# EAGLE design alarm (EAGLE 9.6.2)
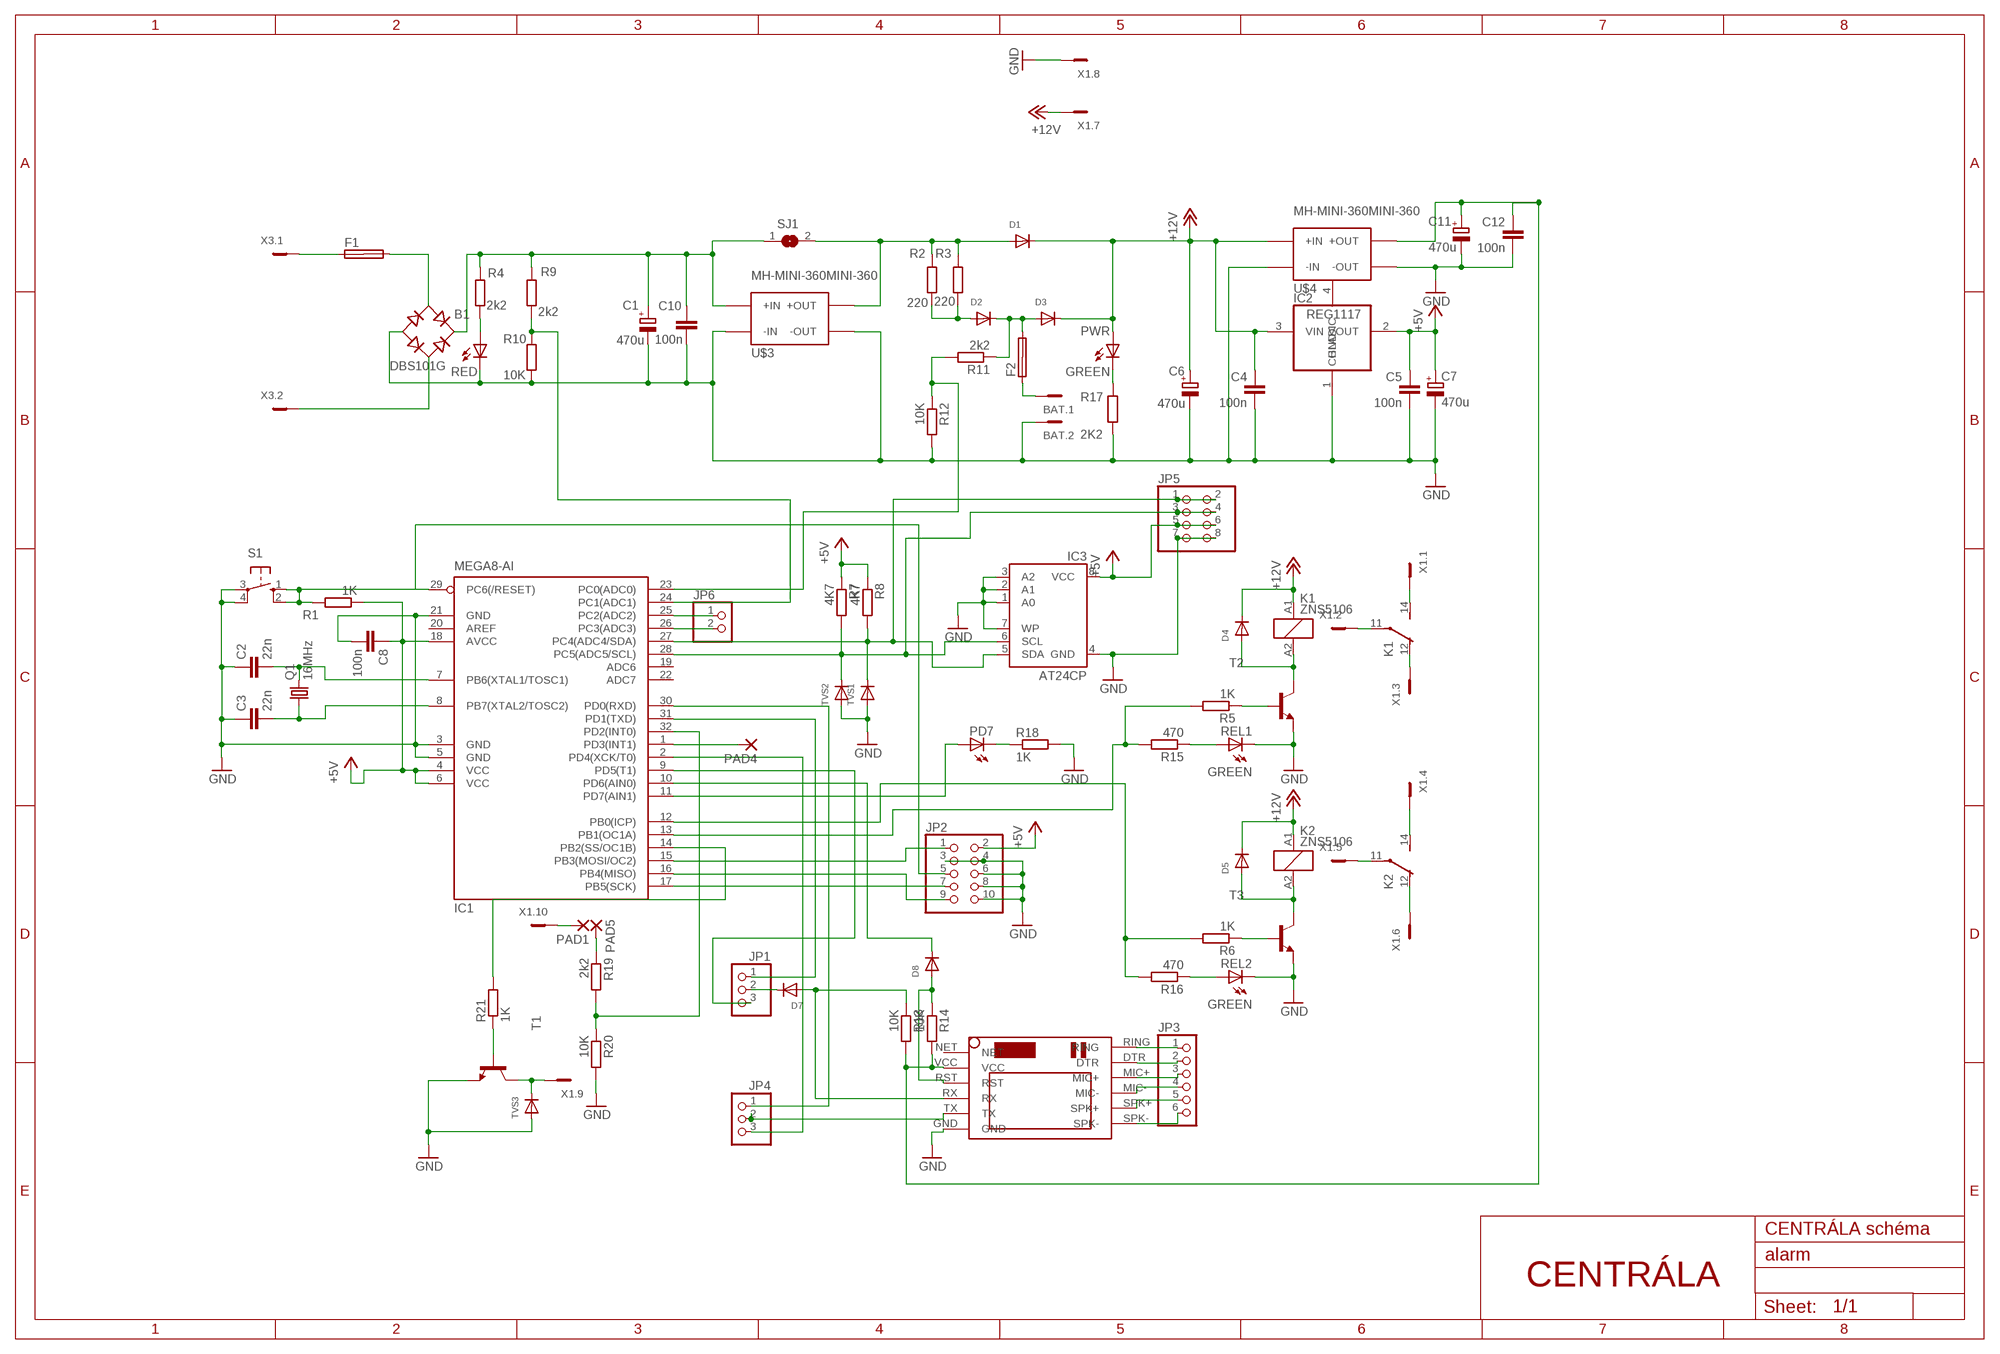
[diagram p0: schematic, sheet 1]

## Parts
B1  DBS101G  [DBS]
BAT  MCV2  [MCV2]
C1  470u  CPOL-EU153CLV-0810  [153CLV-0810]
C2  22n  C-EUC0805  [C0805]
C3  22n  C-EUC0805  [C0805]
C4  100n  C-EUC0805  [C0805]
C5  100n  C-EUC0805  [C0805]
C6  470u  CPOL-EU153CLV-0810  [153CLV-0810]
C7  470u  CPOL-EU153CLV-0810  [153CLV-0810]
C8  100n  C-EUC0805  [C0805]
C10  100n  C-EUC0805  [C0805]
C11  470u  CPOL-EU153CLV-0810  [153CLV-0810]
C12  100n  C-EUC0805  [C0805]
D1  DIODE_SOD-123FL  [SOD-123FL]
D2  DIODE_SOD-123FL  [SOD-123FL]
D3  DIODE_SOD-123FL  [SOD-123FL]
D4  DIODE_SOD-123FL  [SOD-123FL]
D5  DIODE_SOD-123FL  [SOD-123FL]
D7  DIODE_SOD-123FL  [SOD-123FL]
D8  DIODE_SOD-123FL  [SOD-123FL]
F1  SHK20L  [SHK20L]
F2  SHK20L  [SHK20L]
IC1  MEGA8-AI  [TQFP32-08]
IC2  REG1117  [SOT223]
IC3  AT24CP  [DIL08]
JP1  PINHD-1X3  [1X03]
JP2  PINHD-2X5  [2X05]
JP3  PINHD-1X6  [1X06]
JP4  PINHD-1X3  [1X03]
JP5  PINHD-2X4  [2X04]
JP6  PINHD-1X2  [1X02]
K1  ZNS5106  [ZN5]
K2  ZNS5106  [ZN5]
PAD1  2,54/0,8  [2,54/0,8]
PAD4  2,54/0,8  [2,54/0,8]
PAD5  2,54/0,8  [2,54/0,8]
PD7  LEDCHIPLED_0805  [CHIPLED_0805]
PWR  GREEN  LEDCHIPLED_0805  [CHIPLED_0805]
Q1  16MHz  CRYSTALHC49UP  [HC49UP]
R1  1K  R-EU_R0805  [R0805]
R2  220  R-EU_R1210  [R1210]
R3  220  R-EU_R1210  [R1210]
R4  2k2  R-EU_R0805  [R0805]
R5  1K  R-EU_R0805  [R0805]
R6  1K  R-EU_R0805  [R0805]
R7  4K7  R-EU_R0805  [R0805]
R8  4K7  R-EU_R0805  [R0805]
R9  2k2  R-EU_R0805  [R0805]
R10  10K  R-EU_R0805  [R0805]
R11  2k2  R-EU_R0805  [R0805]
R12  10K  R-EU_R0805  [R0805]
R13  10K  R-EU_R0805  [R0805]
R14  10K  R-EU_R0805  [R0805]
R15  470  R-EU_R0805  [R0805]
R16  470  R-EU_R0805  [R0805]
R17  2K2  R-EU_R0805  [R0805]
R18  1K  R-EU_R0805  [R0805]
R19  2k2  R-EU_R0805  [R0805]
R20  10K  R-EU_R0805  [R0805]
R21  1K  R-EU_R0805  [R0805]
REL1  GREEN  LEDCHIPLED_0805  [CHIPLED_0805]
REL2  GREEN  LEDCHIPLED_0805  [CHIPLED_0805]
S1  10-XX  [B3F-10XX]
SJ1  SJW  [SJW]
SUPPLY  RED  LEDCHIPLED_0805  [CHIPLED_0805]
T1  BC808-NPN-SOT23-BEC  [SOT23-BEC]
T2  BC808-NPN-SOT23-BEC  [SOT23-BEC]
T3  BC808-NPN-SOT23-BEC  [SOT23-BEC]
TVS1  DIODE_SOD-123FL  [SOD-123FL]
TVS2  DIODE_SOD-123FL  [SOD-123FL]
TVS3  DIODE_SOD-123FL  [SOD-123FL]
U$1  SIM800LMODULE  [SIM800LMODULE]
U$3  MH-MINI-360MINI-360  [MH-MINI-360]
U$4  MH-MINI-360MINI-360  [MH-MINI-360]
X1  MCV10  [MCV10]
X3  MCV2  [MCV2]

## Nets
+4.4V: C11.+ C12.2 R13.2 R14.2 U$1.VCC U$4.P$3(+OUT)
+5V: C5.2 C7.+ C8.1 IC1.4(VCC) IC1.6(VCC) IC1.18(AVCC) IC2.2(VOUT) IC3.8(VCC) JP2.2 JP5.5 JP5.6 R1.1 R7.1 R8.1
+12V: C4.2 C6.+ D1.C D3.C D4.C D5.C IC2.3(VIN) K1.A1 K2.A1 PWR.A U$4.P$2(+IN) X1.7
GND: B1.- BAT.2 C1.- C2.1 C3.1 C4.1 C5.1 C6.- C7.- C8.2 C10.1 C11.- C12.1 IC1.3(GND) IC1.5(GND) IC1.21(GND) IC2.1(GND) IC3.1(A0) IC3.2(A1) IC3.3(A2) IC3.4(GND) IC3.7(WP) JP2.3 JP2.4 JP2.6 JP2.8 JP2.10 JP5.7 JP5.8 R10.2 R12.2 R17.2 R18.2 R20.2 REL1.C REL2.C S1.3(P) S1.4(P1) SUPPLY.C T1.E T2.E T3.E TVS1.A TVS2.A TVS3.A U$1.GND U$3.P$1(-IN) U$3.P$4(-OUT) U$4.P$1(-IN) U$4.P$4(-OUT) X1.8
N$1: B1.AC1 F1.2A
N$2: B1.AC2 X3.2
N$3: B1.+ C1.+ C10.2 R4.1 R9.1 SJ1.1 U$3.P$2(+IN)
N$4: JP3.6 U$1.SPK-
N$5: D1.A R2.2 R3.2 SJ1.2 U$3.P$3(+OUT)
N$6: D2.A R2.1 R3.1
N$7: D2.C D3.A F2.2A R11.1
N$8: BAT.1 F2.1A
N$9: C3.2 IC1.8(PB7(XTAL2/TOSC2)) Q1.1
N$10: F1.1A X3.1
N$11: IC1.15(PB3(MOSI/OC2)) JP2.1
N$12: C2.2 IC1.7(PB6(XTAL1/TOSC1)) Q1.2
N$13: IC1.17(PB5(SCK)) JP2.7
N$14: R4.2 SUPPLY.A
N$15: IC1.29(PC6(/RESET)) JP2.5 R1.2 S1.1(S) S1.2(S1)
N$16: IC1.16(PB4(MISO)) JP2.9
N$17: IC1.28(PC5(ADC5/SCL)) IC3.6(SCL) JP5.3 JP5.4 R7.2 TVS2.C
N$18: PAD1.1(P) X1.10
N$19: IC1.24(PC1(ADC1)) R9.2 R10.1
N$20: D5.A K2.A2 T3.C
N$21: D4.A K1.A2 T2.C
N$22: R5.1 T2.B
N$23: R6.1 T3.B
N$24: IC1.13(PB1(OC1A)) R5.2 R15.2
N$26: K1.14(2:S) X1.1
N$27: K1.11(2:P) X1.2
N$28: K1.12(2:O) X1.3
N$29: K2.14(2:S) X1.4
N$30: K2.11(2:P) X1.5
N$31: K2.12(2:O) X1.6
N$32: IC1.23(PC0(ADC0)) R11.2 R12.1
N$33: JP3.5 U$1.SPK+
N$34: JP3.4 U$1.MIC-
N$35: JP3.3 U$1.MIC+
N$36: JP3.2 U$1.DTR
N$37: JP3.1 U$1.RING
N$38: JP4.2 U$1.TX
N$39: D7.A R13.1 U$1.RX
N$40: IC1.31(PD1(TXD)) JP1.1
N$41: IC1.30(PD0(RXD)) JP4.1
N$42: IC1.2(PD4(XCK/T0)) JP4.3
N$43: D7.C JP1.2
N$44: IC1.9(PD5(T1)) JP1.3
N$45: D8.A R14.1 U$1.RST
N$46: R16.1 REL2.A
N$47: D8.C IC1.10(PD6(AIN0))
N$48: R15.1 REL1.A
N$49: PWR.C R17.1
N$50: PD7.C R18.1
N$51: IC1.11(PD7(AIN1)) PD7.A
N$52: IC1.27(PC4(ADC4/SDA)) IC3.5(SDA) JP5.1 JP5.2 R8.2 TVS1.C
N$53: IC1.32(PD2(INT0)) R19.2 R20.1
N$54: IC1.14(PB2(SS/OC1B)) R21.2
N$55: IC1.25(PC2(ADC2)) JP6.1
N$56: IC1.26(PC3(ADC3)) JP6.2
N$57: IC1.1(PD3(INT1)) PAD4.1(P)
N$58: R21.1 T1.B
N$59: T1.C TVS3.C X1.9
N$60: PAD5.1(P) R19.1
N$62: IC1.12(PB0(ICP)) R6.2 R16.2
Unconnected: F1.1B F1.2B F2.1B F2.2B IC1.19(ADC6) IC1.20(AREF) IC1.22(ADC7) U$1.NET

## Notes on the sheet
- CENTRÁLA schéma
- CENTRÁLA

## Power pins joined to a net without a drawn wire
CHLADIC: IC2.4(CHLADIC)

## Library data of the parts
B1 = rectifier:DB?*G: Single Phase 1.0 AMP Glass Passivated Bridge Rectifier Taiwan Semiconductor Co.,Ltd. - TSC Source: http://www.taiwansemi.com/TSCbig5/ezcatfiles/cust/img/img/db101g.pdf http://www.ts.com.tw/db/pictures/modules/PDT/PDT060207001/DBLS201G.pdf
BAT X3 = con-phoenix_3.81_mcv:MCV2: Mini-Combicon 3.81mm vertikal 2polig (ohne Gegenstecker)
C1 C6 C7 C11 = rcl:CPOL-EU: POLARIZED CAPACITOR, European symbol; SPICEPREFIX: C
C2-C5 C8 C10 C12 = rcl:C-EU: CAPACITOR, European symbol; SPICEPREFIX: C
D1-D5 D7 D8 TVS1-TVS3 = adafruit:DIODE: Diode SMADIODE - SMA Surface Mount Package 20V 1A Schottky Diode Digikey: 641-1014-6-ND DO-1N4148 - Through Hole Small Current Diode SOD-123 20V 1 A (.5mV Vf) Schottky Diode - Digikey: MBRX120TPMSCT-ND SOD-323 10V 570mA (.38mV Vf, 3ns) Schottky Diode - Digikey: ZLLS410CT-ND SOD-523 30V 30mA Schottky Diode (RB751S-40TE61) - Digikey: RB751S-40TE61CT-ND SOT23-R/W - SOT23 Package (R = Solder Paste/Reflow Ovens, W = Hand-Soldering) BAT54Film 40V 300mA - Digikey: 497-7162-1-ND
F1 F2 = fuse:SHK20L: FUSE HOLDER 5 x 20 mm, SH contact, SHH1 Schukat, E1073 Buerklin; OC_FARNELL: unknown; OC_NEWARK: unknown
IC1 = atmel:MEGA8: MICROCONTROLLER 8 Kbytes FLASH, 1 kbytes SRAM, 512 bytes EEPROM, USART, 6-channel 10 bit ADC, 2-channel 8 bit ADC Pin compatible with Atmega48, ATMega88, ATMega168 Source: avr.lbr; MPN: ATMEGA8-16AU; OC_FARNELL: 9171371; OC_NEWARK: 73M8863
IC2 = burr-brown:REG1117: 800mA and 1A Low Dropout (LDO) Positive Regulator 1.8V, 2.5V, 2.85V, 3.3V, 5V, and Adj; MPN: REG1117; OC_FARNELL: 1097566; OC_NEWARK: 14P6981
IC3 = atmel:AT24C*: 2-wire serial EEPROM; MPN: AT24C1024BW-SH-B; OC_FARNELL: 1362646; OC_NEWARK: 03P2044
JP1 JP4 = pinhead:PINHD-1X3: PIN HEADER
JP2 = pinhead:PINHD-2X5: PIN HEADER
JP3 = pinhead:PINHD-1X6: PIN HEADER
JP5 = pinhead:PINHD-2X4: PIN HEADER
JP6 = pinhead:PINHD-1X2: PIN HEADER
K1 K2 = relay:ZNS5*: Miniature Power PCB Relay SCHRACK 1pole 10 A Source: http://www.schrack.com/.. 5847.pdf
PAD1 PAD4 PAD5 = wirepad:2,54/0,8: THROUGH-HOLE PAD
PD7 PWR REL1 REL2 SUPPLY = led:LED: LED OSRAM: - CHIPLED LG R971, LG N971, LY N971, LG Q971, LY Q971, LO R971, LY R971 LH N974, LH R974 LS Q976, LO Q976, LY Q976 LO Q996 - Hyper CHIPLED LW Q18S LB Q993, LB Q99A, LB R99A - SideLED LS A670, LO A670, LY A670, LG A670, LP A670 LB A673, LV A673, LT A673, LW A673 LH A674 LY A675 LS A676, LA A676, LO A676, LY A676, LW A676 LS A679, LY A679, LG A679 - Hyper Micro SIDELED® LS Y876, LA Y876, LO Y876, LY Y876 LT Y87S - SmartLED LW L88C, LW L88S LB L89C, LB L89S, LG L890 LS L89K, LO L89K, LY L89K LS L896, LA L896, LO L896, LY L896 - TOPLED LS T670, LO T670, LY T670, LG T670, LP T670 LSG T670, LSP T670, LSY T670, LOP T670, LYG T670 LG T671, LOG T671, LSG T671 LB T673, LV T673, LT T673, LW T673 LH T674 LS T676, LA T676, LO T676, LY T676, LB T676, LH T676, LSB T676, LW T676 LB T67C, LV T67C, LT T67C, LS T67K, LO T67K, LY T67K, LW E67C LS E67B, LA E67B, LO E67B, LY E67B, LB E67C, LV E67C, LT E67C LW T67C LS T679, LY T679, LG T679 LS T770, LO T770, LY T770, LG T770, LP T770 LB T773, LV T773, LT T773, LW T773 LH T774 LS E675, LA E675, LY E675, LS T675 LS T776, LA T776, LO T776, LY T776, LB T776 LHGB T686 LT T68C, LB T68C - Hyper Mini TOPLED® LB M676 - Mini TOPLED Santana® LG M470 LS M47K, LO M47K, LY M47K Source: http://www.osram.convergy.de LUXEON: - LUMILED® LXK2-PW12-R00, LXK2-PW12-S00, LXK2-PW14-U00, LXK2-PW14-V00 LXK2-PM12-R00, LXK2-PM12-S00, LXK2-PM14-U00 LXK2-PE12-Q00, LXK2-PE12-R00, LXK2-PE12-S00, LXK2-PE14-T00, LXK2-PE14-U00 LXK2-PB12-K00, LXK2-PB12-L00, LXK2-PB12-M00, LXK2-PB14-N00, LXK2-PB14-P00, LXK2-PB14-Q00 LXK2-PR12-L00, LXK2-PR12-M00, LXK2-PR14-Q00, LXK2-PR14-R00 LXK2-PD12-Q00, LXK2-PD12-R00, LXK2-PD12-S00 LXK2-PH12-R00, LXK2-PH12-S00 LXK2-PL12-P00, LXK2-PL12-Q00, LXK2-PL12-R00 Source: www.luxeon.com KINGBRIGHT: KA-3528ASYC Source: www.kingbright.com
Q1 = crystal:CRYSTAL: CRYSTAL; OC_FARNELL: unknown; OC_NEWARK: unknown
R1-R21 = rcl:R-EU_: RESISTOR, European symbol; SPICEPREFIX: R
S1 = switch-omron:10-XX: OMRON SWITCH; MPN: B3F-1000; OC_FARNELL: 176432; OC_NEWARK: 36M3542
SJ1 = jumper:SJ: SMD solder JUMPER
T1-T3 = transistor-neu-to92:*-NPN-: NPN Transistror
U$1 = SIM800LMODULE:SIM800LMODULE: SIM800L Module
U$3 U$4 = powermodules:MH-MINI-360
X1 = con-phoenix_3.81_mcv:MCV10: Mini-Combicon 3.81mm vertikal 10polig (ohne Gegenstecker)

## Board
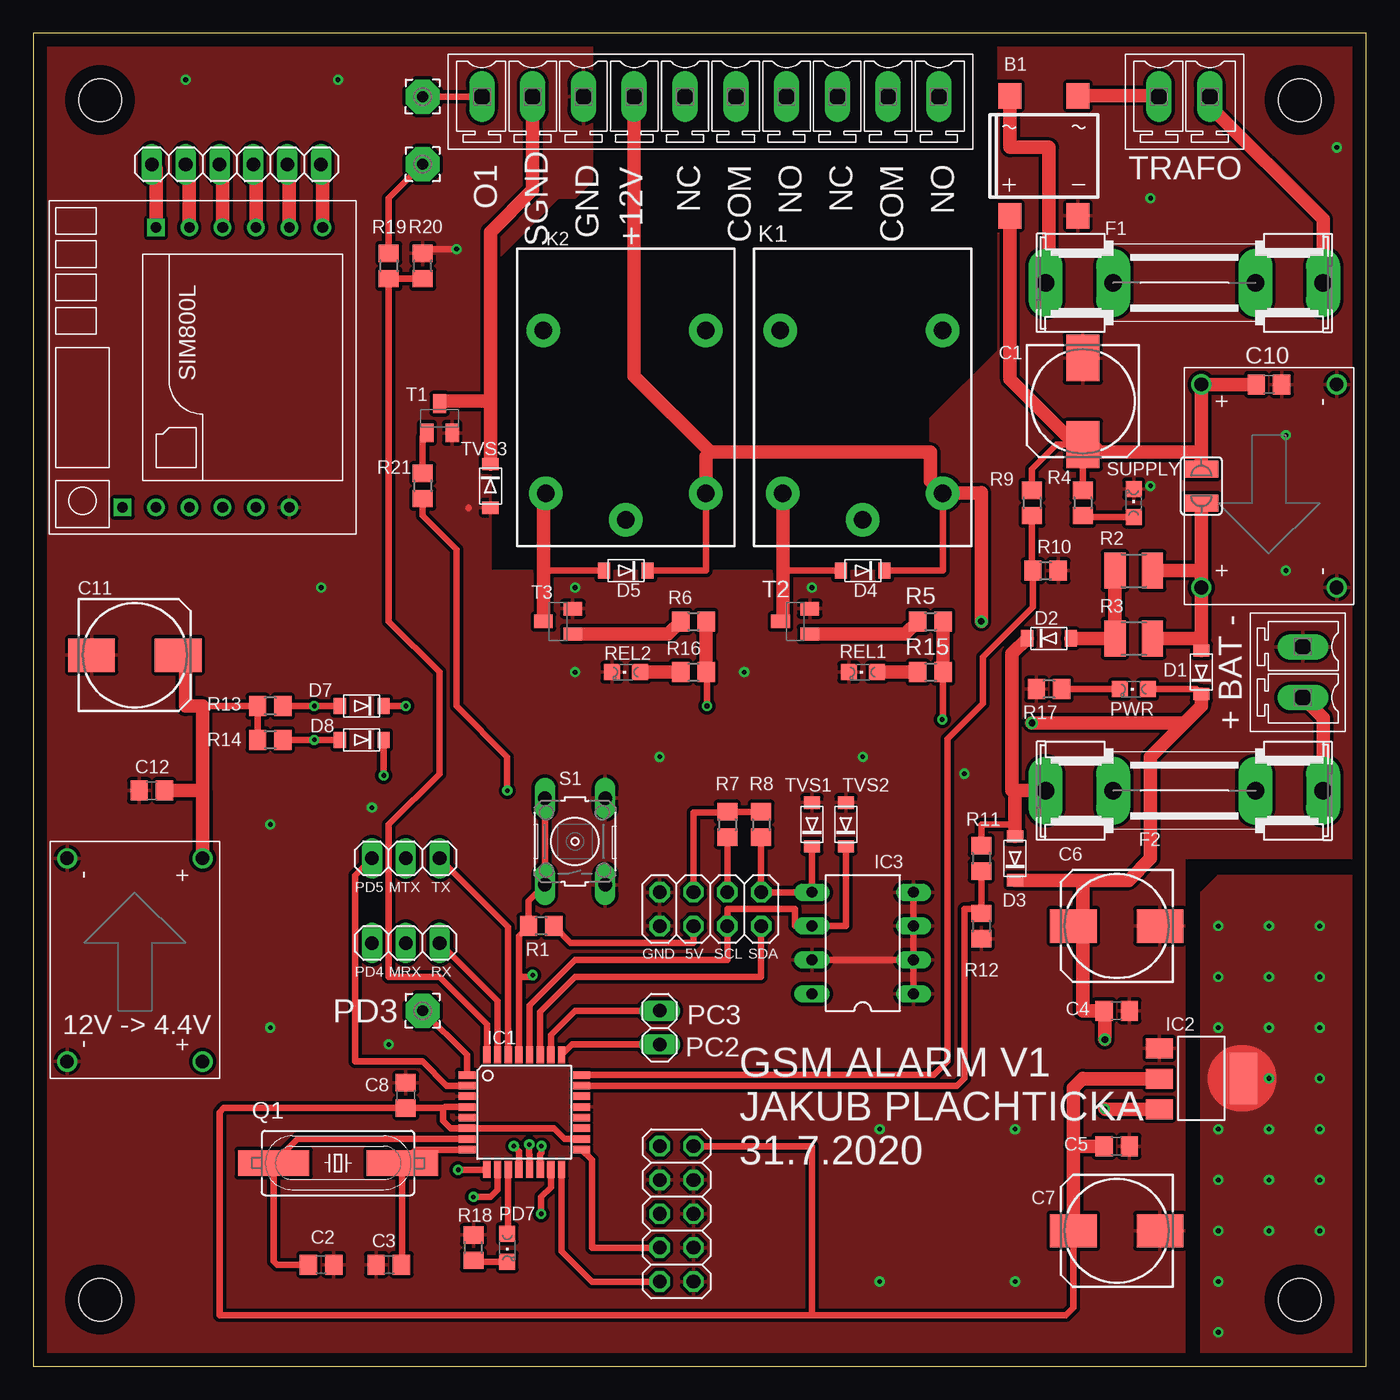
[diagram p1: board, top side]
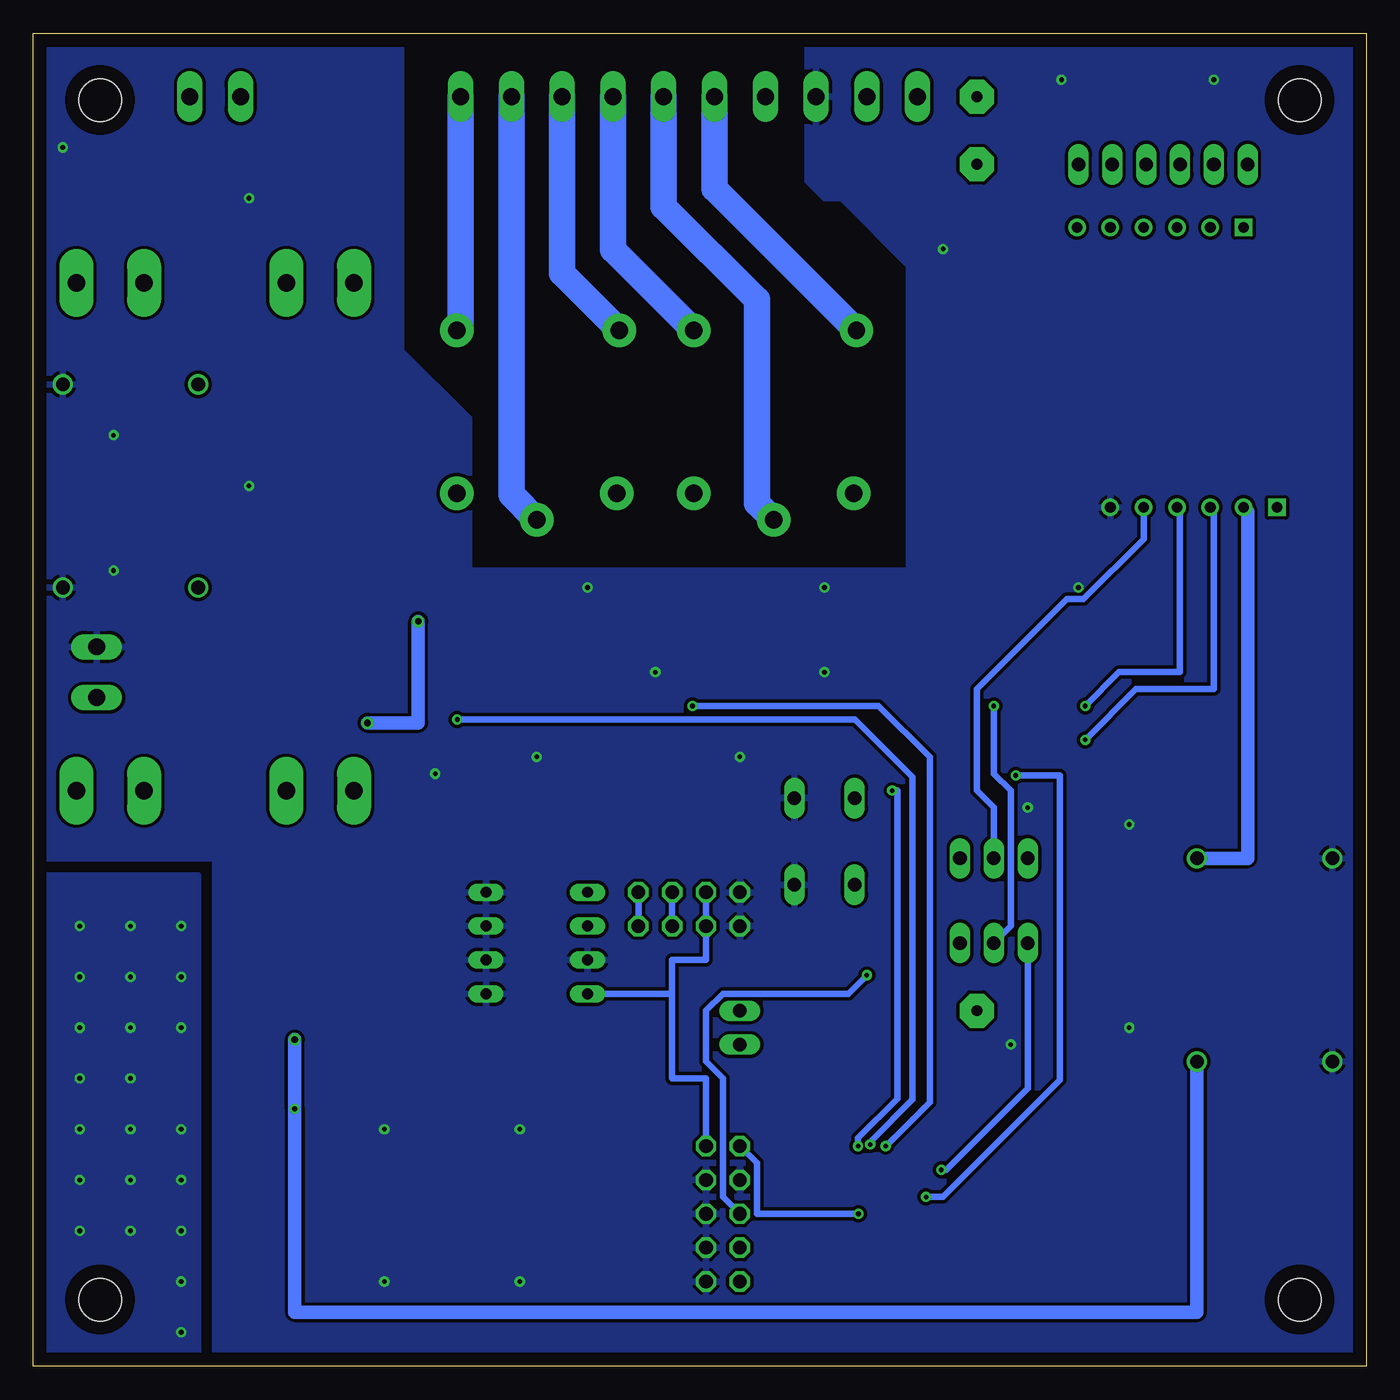
[diagram p2: board, bottom side, seen from below]

Size 100 x 100 mm. Coordinates in mm from the lower left corner, seen from the top.
Outline: 0,0 100,0 100,100 0,100 0,0
Copper layers (1*16): Top 0.035mm / dielectric 1.5mm / Bottom 0.035mm
Design rules "default *": minimum track width 6mil, minimum drill 0.35mm, track to track 10mil, track to pad 10mil, pad to pad 6mil, via to via 6mil, smd to smd 6mil, copper to edge 40mil, drill to drill 6mil, minimum pad ring 10mil, minimum via ring 8mil, stop-mask expansion 4mil, vias tented up to drill 0mil, thermal gap 10mil
Holes 3.2 mm at 95,95 95,5 5,5 5,95

### Footprints (pad centres in the part's own frame; a part is rotated, then mirrored left to right if it is on the bottom)
DBS = smd 1.7 x 1.9: + -2.55,-4.5; - 2.55,-4.5; AC1 -2.55,4.5; AC2 2.55,4.5
MCV2 = drill 1.27 pad 1.905 long: 1 -1.905,0; 2 1.905,0
153CLV-0810 = smd 3.5 x 2.5: + 3.25,0; - -3.25,0
C0805 = smd 1.3 x 1.5: 1 -0.95,0; 2 0.95,0
SOD-123FL = smd 0.91 x 1.22: A 1.637,0; C -1.637,0
SHK20L = drill 1.321 pad 2.54 long: 1A -10.414,0; 1B -5.334,0; 2A 10.414,0; 2B 5.334,0
TQFP32-08 = smd 1.27 x 0.559: 1 -4.293,2.8; 2 -4.293,2; 3 -4.293,1.2; 4 -4.293,0.4; 5 -4.293,-0.4; 6 -4.293,-1.2; 7 -4.293,-2; 8 -4.293,-2.8; 17 4.293,-2.8; 18 4.293,-2; 19 4.293,-1.2; 20 4.293,-0.4; 21 4.293,0.4; 22 4.293,1.2; 23 4.293,2; 24 4.293,2.8 | smd 0.559 x 1.27: 9 -2.8,-4.293; 10 -2,-4.293; 11 -1.2,-4.293; 12 -0.4,-4.293; 13 0.4,-4.293; 14 1.2,-4.293; 15 2,-4.293; 16 2.8,-4.293; 25 2.8,4.293; 26 2,4.293; 27 1.2,4.293; 28 0.4,4.293; 29 -0.4,4.293; 30 -1.2,4.293; 31 -2,4.293; 32 -2.8,4.293
SOT223 = smd 1.499 x 2.007: 1 -2.261,-3.15; 2 0.025,-3.15; 3 2.311,-3.15 | smd 3.81 x 2.007: 4 0,3.15
DIL08 = drill 0.813 long: 1 -3.81,-3.81; 2 -1.27,-3.81; 3 1.27,-3.81; 4 3.81,-3.81; 5 3.81,3.81; 6 1.27,3.81; 7 -1.27,3.81; 8 -3.81,3.81
1X03 = drill 1.016 long: 1 -2.54,0; 2 0,0; 3 2.54,0
2X05 = drill 1.016 octagon: 1 -5.08,-1.27; 2 -5.08,1.27; 3 -2.54,-1.27; 4 -2.54,1.27; 5 0,-1.27; 6 0,1.27; 7 2.54,-1.27; 8 2.54,1.27; 9 5.08,-1.27; 10 5.08,1.27
1X06 = drill 1.016 long: 1 -6.35,0; 2 -3.81,0; 3 -1.27,0; 4 1.27,0; 5 3.81,0; 6 6.35,0
2X04 = drill 1.016 octagon: 1 -3.81,-1.27; 2 -3.81,1.27; 3 -1.27,-1.27; 4 -1.27,1.27; 5 1.27,-1.27; 6 1.27,1.27; 7 3.81,-1.27; 8 3.81,1.27
1X02 = drill 1.016 long: 1 -1.27,0; 2 1.27,0
ZN5 = drill 1.3 pad 2.5: 11 8.89,0; 12 -5.31,-6.2; 14 -5.31,6; A1 6.89,6; A2 6.89,-6
2,54/0,8 = drill 0.813 pad 2.54 octagon: 1 0,0
CHIPLED_0805 = smd 1.2 x 1.2: A 0,-1.05; C 0,1.05
HC49UP = smd 5.334 x 1.93: 1 -4.826,0; 2 4.826,0
R0805 = smd 1.3 x 1.5: 1 -0.95,0; 2 0.95,0
R1210 = smd 1.6 x 2.7: 1 -1.4,0; 2 1.4,0
B3F-10XX = drill 1.016 long: 1 -3.251,2.261; 2 3.251,2.261; 3 -3.251,-2.261; 4 3.251,-2.261
SJW = smd 1.27 x 2.54: 1 -1.27,0; 2 1.27,0
SOT23-BEC = smd 1 x 1.4: B -0.95,-1.1; C 0,1.1; E 0.95,-1.1
SIM800LMODULE = drill 0.8: DTR 10.5,1; GND -10.5,-6.5; MIC+ 10.5,-1.5; MIC- 10.5,-4; RST -10.5,1; RX -10.5,-1.5; SPK+ 10.5,-6.5; SPK- 10.5,-9; TX -10.5,-4; VCC -10.5,3.5 | drill 0.8 square: NET -10.5,6; RING 10.5,3.5
MH-MINI-360 = drill 1.016: P$1 -7.62,5.08; P$2 -7.62,-5.08; P$3 7.62,-5.08; P$4 7.62,5.08
MCV10 = drill 1.27 pad 1.905 long: 1 -17.145,0; 2 -13.335,0; 3 -9.525,0; 4 -5.715,0; 5 -1.905,0; 6 1.905,0; 7 5.715,0; 8 9.525,0; 9 13.335,0; 10 17.145,0

### Placement (x,y rotation side)
B1  75.82,90.81 0 top
BAT  95.25,52.07 90 top
C1  78.74,72.39 270 top
C2  21.59,7.62 180 top
C3  26.67,7.62 0 top
C4  81.28,26.67 180 top
C5  81.28,16.51 180 top
C6  81.28,33.02 180 top
C7  81.28,10.16 180 top
C8  27.94,20.32 90 top
C10  92.71,73.66 180 top
C11  7.62,53.34 0 top
C12  8.89,43.18 0 top
D1  87.63,52.07 90 top
D2  76.2,54.61 0 top
D3  73.66,38.1 90 top
D4  62.23,59.69 180 top
D5  44.45,59.69 180 top
D7  24.64,49.53 180 top
D8  24.64,46.99 180 top
F1  86.36,81.28 180 top
F2  86.36,43.18 180 top
IC1  36.83,19.05 0 top
IC2  87.63,21.59 270 top
IC3  62.23,31.75 90 top
JP1  27.94,31.75 180 top
JP2  48.26,11.43 270 top
JP3  15.24,90.17 0 top
JP4  27.94,38.1 180 top
JP5  50.8,34.29 180 top
JP6  46.99,25.4 90 top
K1  62.23,72.39 270 top
K2  44.45,72.39 270 top
PAD1  29.21,95.25 0 top
PAD4  29.21,26.67 0 top
PAD5  29.21,90.17 0 top
PD7  35.56,8.89 180 top
PWR  82.55,50.8 90 top
Q1  22.86,15.24 180 top
R1  38.1,33.02 180 top
R2  82.55,59.69 0 top
R3  82.55,54.61 0 top
R4  78.74,64.77 270 top
R5  67.31,55.88 0 top
R6  49.53,55.88 0 top
R7  52.07,40.64 270 top
R8  54.61,40.64 270 top
R9  74.93,64.77 270 top
R10  75.95,59.69 0 top
R11  71.12,38.1 270 top
R12  71.12,33.02 270 top
R13  17.78,49.53 180 top
R14  17.78,46.99 180 top
R15  67.31,52.07 0 top
R16  49.53,52.07 0 top
R17  76.2,50.8 180 top
R18  33.02,8.89 90 top
R19  26.67,82.55 270 top
R20  29.21,82.55 90 top
R21  29.21,66.04 270 top
REL1  62.23,52.07 90 top
REL2  44.45,52.07 90 top
S1  40.64,39.37 90 top
SJ1  87.63,66.04 270 top
SUPPLY  82.55,64.77 0 top
T1  30.48,71.12 0 top
T2  57.15,55.88 90 top
T3  39.37,55.88 90 top
TVS1  58.42,40.64 90 top
TVS2  60.96,40.64 90 top
TVS3  34.29,66.04 270 top
U$1  12.7,74.93 90 top
U$3  92.71,66.04 270 top
U$4  7.62,30.48 90 top
X1  50.8,95.25 180 top
X3  86.36,95.25 180 top

### Tracks (layer width: path | path; a pad name or v marks a point on that pad's centre or on a via)
+4.4V
  Top 0.5: R14.2 R13.2 12.7,49.53
  Top 1: C12.2 12.7,43.18 U$4.P$3 12.7,49.53 11.43,49.53 11.43,53.34 C11.+
  Bottom 1: U$4.P$3 8.89,38.1 8.89,64.12 U$1.VCC
+5V
  Top 0.5: IC1.18 39.85,17.05 39.05,17.85 IC1.6 31.3,17.85 30.73,18.41 30.73,19.3 30.8,19.37 | IC1.4 30.88,19.45 30.8,19.37 | 58.42,3.81 13.97,3.81 13.97,19.05 14.29,19.37 C8.1 30.8,19.37 | 58.42,3.81 58.42,16.51 JP2.2 | R8.1 R7.1 52.01,41.53 49.53,41.53 JP5.5 | R1.1 40.32,31.75 49.53,31.75 JP5.6 | 58.42,3.81 77.47,3.81 78.03,4.37 C7.+
  Top 1: 78.03,16.51 78.03,20.88 78.74,21.59 78.77,21.57 IC2.2 | 78.03,16.51 C7.+ | 78.03,16.51 C5.2
  Bottom 0.5: JP5.5 JP5.6 49.53,30.48 52.07,30.48 52.07,27.94 | 52.07,27.94 52.07,21.59 49.53,21.59 JP2.2 | IC3.8 52.07,27.94
+12V  (via drill 0.35, 0.5)
  Top 0.5: D4.C 68.23,59.69 K1.A1 | D5.C 50.45,59.69 K2.A1 | PWR.A 87.26,50.8 D1.C | C6.+ 78.74,33.73
  Top 1: K2.A1 50.45,68.23 50.8,68.58 | 50.8,68.58 67.31,68.58 67.31,66.42 K1.A1 71.09,65.5 71.12,65.53 v71.12,55.88 | D1.C 87.63,49.53 86.36,48.26 | 86.36,48.26 83.82,45.72 83.82,38.1 82.18,36.46 78.74,36.46 | C6.+ 78.74,32.31 78.74,26.67 C4.2 80.39,26.61 v80.39,24.51 | D3.C 78.74,36.46 | 78.74,33.73 78.74,36.46 | IC2.3 80.42,19.28 v80.39,19.3 | 86.36,48.26 v74.93,48.26 | 50.8,68.58 45.09,74.3 X1.7
  Bottom 1: v80.39,24.51 v80.39,19.3 80.39,4.06 12.7,4.06 U$4.P$2 | v74.93,48.26 71.12,48.26 v71.12,55.88
CHLADIC  (via drill 0.35, 0.35 pad 0.55)
  Top 5: IC2.4 90.61,21.59
  other vias: 92.71,21.59 88.9,33.02 92.71,33.02 88.9,29.21 88.9,25.4 92.71,25.4 92.71,29.21 96.52,33.02 96.52,29.21 96.52,25.4 96.52,21.59 88.9,17.78 88.9,13.97 88.9,10.16 88.9,6.35 88.9,2.54 92.71,10.16 96.52,10.16 92.71,13.97 96.52,13.97 92.71,17.78 96.52,17.78
  pour Top: 88.9,36.83 100.33,36.83 100.33,0 87.63,0 87.63,35.56
  pour Bottom: 87.63,24.13 87.63,36.83 100.33,36.83 100.33,0 87.63,0
GND  (via drill 0.35)
  Top 0.5: IC3.4 IC3.3 IC3.2 | IC3.2 IC3.1 | IC3.7 IC3.2 | 32.65,64.4 32.64,64.39 | v31.75,83.82 29.53,83.82 R20.2
  other vias: 58.42,58.42 40.64,58.42 53.34,52.07 40.64,52.07 83.82,66.04 11.43,96.52 22.86,96.52 21.59,58.42 17.78,40.64 17.78,25.4 63.5,17.78 63.5,6.35 73.66,6.35 73.66,17.78 46.99,45.72 62.23,45.72 93.98,59.69 93.98,69.85 83.82,87.63 97.79,91.44 26.67,24.13 69.85,44.45 25.4,41.91
  pour Bottom: 0,100.33 0,0 86.36,0 86.36,38.1 100.33,38.1 100.33,100.33 72.39,100.33 72.39,76.2 67.31,71.12 67.31,59.69 34.29,59.69 34.29,82.55 39.37,87.63 40.64,87.63 41.91,88.9 41.91,100.33
  pour Top: 0,100.33 41.91,100.33 41.91,88.9 40.64,87.63 39.37,87.63 34.29,82.55 34.29,59.69 67.31,59.69 67.31,71.12 72.39,76.2 72.39,100.33 100.33,100.33 100.33,38.1 86.36,38.1 86.36,0 0,0
N$1
  Top 1: B1.AC1 73.27,91.44 76.2,91.44 76.2,81.53 F1.2A
N$2
  Top 1: X3.2 84.4,95.31 B1.AC2
N$3
  Top 0.5: R9.1 74.93,67.31 76.76,69.14 C1.+ R4.1
  Top 1: 87.63,68.58 U$3.P$2 C10.2 | 87.63,68.58 SJ1.1 | B1.+ 73.27,74.05 78.18,69.14 C1.+ 79.45,69.14 80.01,68.58 87.63,68.58
N$4
  Top 1: U$1.SPK- 21.7,90.06 JP3.6
N$5
  Top 1: 87.63,54.61 U$3.P$3 87.63,59.69 | R3.2 87.63,54.61 | 87.63,59.69 R2.2 | D1.A 87.63,54.61 | SJ1.2 87.63,59.69
N$6
  Top 1: R2.1 R3.1 81.15,54.85 80.89,54.61 D2.A
N$7
  Top 0.5: R11.1 71.12,40.64 73.66,40.64
  Top 1: D2.C 73.41,53.45 73.41,43.18 | F2.2A 73.41,43.18 | 73.41,43.18 73.66,42.93 73.66,40.64 D3.A
N$8
  Top 1: BAT.1 96.77,48.64 F2.1A
N$9
  Top 0.5: IC1.8 28.7,16.25 Q1.1 27.69,7.69 C3.2
N$10
  Top 1: F1.1A 96.77,86.04 88.27,94.55 X3.1
N$11  (via drill 0.35)
  Top 0.5: IC1.15 38.83,13.43 38.1,12.7 v38.1,11.43
  Bottom 0.5: v38.1,11.43 45.72,11.43 45.72,15.24 JP2.1
N$12
  Top 0.5: IC1.7 19.84,17.05 Q1.2 18.03,7.87 18.29,7.62 C2.2
N$13
  Top 0.5: IC1.17 41.91,15.46 41.91,8.89 JP2.7
N$14
  Top 0.5: R4.2 78.84,63.72 SUPPLY.A
N$15  (via drill 0.35)
  Top 0.5: S1.2 S1.1 37.15,34.89 R1.2 36.43,32.3 36.43,29.21 | IC1.29 36.43,29.21 | v37.47,29.34 37.34,29.21 36.43,29.21
  Bottom 0.5: v37.47,29.34 38.86,27.94 48.27,27.94 49.53,26.68 49.53,22.86 48.26,21.59 48.26,12.7 JP2.5
N$16
  Top 0.5: IC1.16 39.63,8.63 41.91,6.35 JP2.9
N$17
  Top 0.5: R7.2 JP5.3 | TVS2.C 60.96,33.02 IC3.6 57.15,33.02 57.15,34.29 52.07,34.29 JP5.4 52.07,30.48 40.64,30.48 37.23,27.07 IC1.28
  Bottom 0.5: JP5.3 JP5.4
N$18
  Top 0.5: PAD1.1 X1.10
N$19
  Top 0.5: R9.2 74.93,59.76 R10.1 75,56.97 71.24,53.21 71.24,49.73 68.58,47.07 68.58,22.86 67.57,21.85 IC1.24
N$20
  Top 0.5: D5.A 38.27,59.69
  Top 1: T3.C 38.27,59.69 38.27,65.32 K2.A2
N$21
  Top 0.5: D4.A 56.23,59.69
  Top 1: K1.A2 56.23,59.69 56.23,56.06 T2.C
N$22
  Top 1: T2.B 65.41,54.93 R5.1
N$23
  Top 1: T3.B 47.63,54.93 R6.1
N$24  (via drill 0.35)
  Top 0.5: IC1.13 37.23,15.86 37.21,15.88 v37.21,16.64 | v68.2,48.51 68.26,48.58 R15.2
  Top 1: R5.2 R15.2
  Bottom 0.5: v37.21,16.64 37.08,16.77 37.08,16.96 34.04,20.01 34.04,44.2 38.35,48.51 v68.2,48.51
N$26
  Bottom 2: X1.1 67.94,77.98 K1.14
N$27
  Bottom 2: K1.11 64.14,65.41 X1.2
N$28
  Bottom 2: X1.3 60.33,82 K1.12
N$29
  Bottom 2: X1.4 56.52,83.77 K2.14
N$30
  Bottom 2: K2.11 45.72,64.77 45.72,80.01 52.7,87 X1.5
N$31
  Bottom 2: X1.6 48.9,88.34 K2.12
N$32
  Top 0.5: R11.2 R12.1 70.8,34.29 69.85,34.29 69.85,21.59 69.31,21.05 IC1.23
N$33
  Top 1: U$1.SPK+ 19.2,90.02 JP3.5
N$34
  Top 1: U$1.MIC- 16.7,89.98 JP3.4
N$35
  Top 1: U$1.MIC+ 14.2,89.94 JP3.3
N$36
  Top 1: U$1.DTR 11.7,89.9 JP3.2
N$37
  Top 1: U$1.RING 9.2,89.86 JP3.1
N$38
  Bottom 0.5: JP4.2 27.94,41.91 29.21,43.18 29.21,50.8 22.47,57.54 21.23,57.54 16.7,62.06 U$1.TX
N$39  (via drill 0.35)
  Top 0.5: R13.1 v21.08,49.53 D7.A
  Bottom 0.5: v21.08,49.53 18.54,52.07 13.97,52.07 13.97,64.2 U$1.RX
N$40
  Top 0.5: JP1.1 34.83,27.4 IC1.31
N$41
  Top 0.5: JP4.1 35.63,32.95 IC1.30
N$42
  Top 0.5: JP4.3 24.13,36.83 24.13,22.86 29.21,22.86 31.02,21.05 IC1.2
N$43  (via drill 0.35)
  Top 0.5: D7.C v27.94,49.53
  Bottom 0.5: v27.94,49.53 27.94,44.45 26.67,43.18 26.67,33.02 JP1.2
N$44  (via drill 0.35)
  Top 0.5: v31.88,14.73 34.01,14.73 IC1.9
  Bottom 0.5: v31.88,14.73 31.5,14.73 25.4,20.83 JP1.3
N$45  (via drill 0.35)
  Top 0.5: R14.1 v21.08,46.99 D8.A
  Bottom 0.5: U$1.RST 11.43,64.16 11.43,50.8 17.27,50.8 v21.08,46.99
N$46
  Top 1: R16.1 REL2.A
N$47  (via drill 0.35)
  Top 0.5: IC1.10 34.83,13.24 34.29,12.7 v33.02,12.7 | v26.29,44.32 26.29,46.98 D8.C
  Bottom 0.5: v33.02,12.7 31.75,12.7 22.99,21.46 22.99,44.32 v26.29,44.32
N$48
  Top 1: R15.1 REL1.A
N$49
  Top 0.5: R17.1 PWR.C
N$50
  Top 0.5: R18.1 32.92,7.84 PD7.C
N$51
  Top 0.5: PD7.A 35.63,10.01 IC1.11
N$52
  Top 0.5: IC1.27 38.03,26.6 40.64,29.21 54.61,29.21 JP5.2 | R8.2 JP5.1 IC3.5 TVS1.C
  Bottom 0.5: JP5.1 JP5.2
N$53
  Top 0.5: R20.1 R19.2 26.67,55.88 30.48,52.07 30.48,44.45 26.67,40.64 26.67,30.46 26.67,29.21 30.48,29.21 34.03,25.66 IC1.32
N$54  (via drill 0.35)
  Top 0.5: IC1.14 38.03,15.91 38.12,16 v38.12,16.51 | v35.56,43.18 35.56,45.72 31.75,49.53 31.75,61.28 29.21,63.82 R21.2
  Bottom 0.5: v38.12,16.51 38.12,17.12 35.18,20.07 35.18,43.18 v35.56,43.18
N$55
  Top 0.5: IC1.25 40.42,24.13 JP6.1
N$56
  Top 0.5: IC1.26 38.83,24.86 40.64,26.67 JP6.2
N$57
  Top 0.5: IC1.1 32.54,23.34 PAD4.1
N$58
  Top 0.5: R21.1 29.21,69.7 T1.B
N$59
  Top 0.5: 30.65,72.39 T1.C
  Top 1: 30.65,72.39 34.29,72.39 | 34.29,72.39 TVS3.C | 34.29,72.39 34.29,85.09 37.47,88.27 X1.9
N$60
  Top 0.5: PAD5.1 26.67,87.63 R19.1
N$62  (via drill 0.35)
  Top 0.5: v50.55,49.53 50.55,52 R16.2 | IC1.12 36.43,16.13 v36.05,16.51
  Top 1: R6.2 R16.2
  Bottom 0.5: v36.05,16.51 32.75,19.81 32.75,45.7 36.58,49.53 v50.55,49.53

### Text on the board
tNames: SGND | O1 | GND | NC | COM | NO | NC | COM | NO | TRAFO | +12V | + BAT - | PD5 | MTX | TX | GND | 5V | SCL | SDA | PD4 | MRX | RX | 12V -> 4.4V | PD3 | PC3 | PC2 | GSM ALARM V1 / JAKUB PLACHTICKA / 31.7.2020